# EasyEDA Pro project htx-studio-project_kpilekig-42ad306f.epro, board MotorLimit
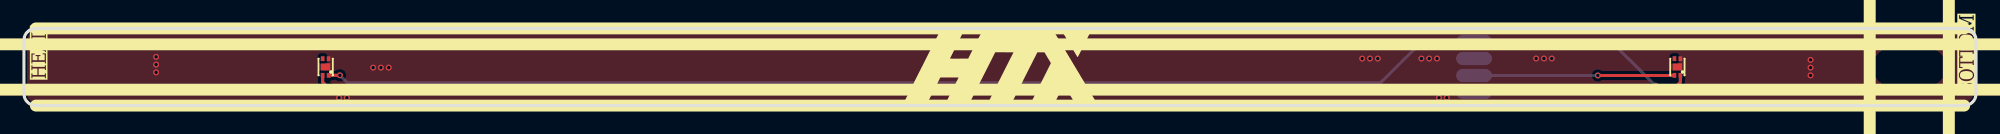
[diagram p8: board, top side]
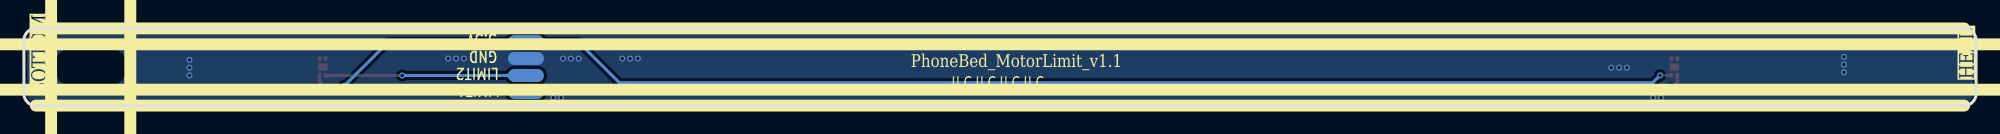
[diagram p9: board, bottom side, seen from below]

Outline 163.19 x 6.5 mm; copper layers: Top Layer, Bottom Layer. Coordinates in mm from the lower left corner of the outline.
Outline path: 0,5.5 0,1 arc(0.29,0.29) 1,0 162.19,0 arc(162.9,0.29) 163.19,1 163.19,5.5 arc(162.9,6.21) 162.19,6.5 1,6.5 arc(0.29,6.21) 0,5.5
Stack: Top Layer 0.035mm / Dielectric1 1.51mm FR4 er 4.5 / Bottom Layer 0.035mm

## Design rules (mm)
spacing copperThickness1oz (default): track to track 0.102, other pairs 0.152 to 0.3
spacing copperThickness2oz: track to track 0.203, other pairs 0.152 to 0.3
spacing Plane_innerPlane: track to track 0.102, other pairs 0.152 to 0.3
spacing Copper_copperRegion: track to track 0.102, other pairs 0.152 to 0.3
track width copperThickness1oz (default): min 0.127, default 0.254, max 2.54
track width copperThickness2oz: min 0.203, default 0.254, max 2.54
differential pair differentialPair (default): width min 0.127, default 0.254, max 2.54; gap min 0.152, default 0.152
pour e25 uses Copper_copperRegion
pour e67 uses Copper_copperRegion

## Placement (name value [footprint] x y rotation side)
NOREF  -  [Pad_e3]  121.22 3.96 180 top
NOREF#2  -  [Pad_e1]  121.22 1.11 180 top
NOREF#3  -  [Pad_e2]  121.22 2.54 180 top
NOREF#4  -  [Pad_e4]  121.22 5.39 180 top
U17  DRV5032FADMRR  [XFDFN-4_L1.4-W1.1-P0.50-BL-EP]  25.22 3.25 90 top
U22  DRV5032FADMRR  [XFDFN-4_L1.4-W1.1-P0.50-BL-EP]  138.22 3.25 90 top

## Footprints (pads in the part's own frame, mm; a bottom-side part is the same pattern mirrored in y, then rotated)
Pad_e1
  oval 3x1.1 smd far side: 1(0,0)
Pad_e2
  oval 3x1.1 smd far side: 1(0,0)
Pad_e3
  oval 3x1.1 smd far side: 1(0,0)
Pad_e4
  oval 3x1.1 smd far side: 1(0,0)
XFDFN-4_L1.4-W1.1-P0.50-BL-EP
  rect 0.4x0.3 smd: 1(-0.7,-0.25) 2(0.7,-0.25) 3(0.7,0.25) 4(-0.7,0.25)
  rect 0.6x0.8 smd: 5(0,0)

## Nets
+3.3V: NOREF#4.1 U17.1 U22.1
GND: NOREF.1 U17.2 U17.5 U22.2 U22.5
GPIO1: NOREF#2.1 U17.4
GPIO2: NOREF#3.1 U22.4

Pads without a net: U17 3; U22 3

## Via types
v1: diameter 0.5, hole 0.3, Top Layer to Bottom Layer, 29 vias

## Routing (per net, layer and track width the routed paths; a pad name or vN(x,y) marks a point on that pad's centre or on a via; arc(x,y) is an arc through that point)
+3.3V: length 116.9
  Top Layer w0.254: v1(136.4,1.67) 138.18,1.67 138.47,1.97 U22.1 ; U17.1 v1(26.42,2.55)
  Bottom Layer w0.254: v1(136.4,1.67) 132.68,5.39 NOREF#4.1 116.88,5.39 113.41,1.93 27.04,1.93 v1(26.42,2.55)
GND:
  vias: v1(11.05,4.11) v1(11.05,3.45) v1(11.05,2.8) v1(26.34,0.66) v1(27,0.66) v1(29.19,3.2) v1(29.84,3.2) v1(30.5,3.2) v1(111.87,3.96) v1(112.52,3.96) v1(113.17,3.96) v1(116.82,3.96) v1(117.48,3.96) v1(118.13,3.96) v1(118.29,0.66) v1(118.94,0.66) v1(123.81,1.17) v1(124.46,1.17) v1(125.11,1.17) v1(126.41,3.96) v1(127.07,3.96) v1(127.72,3.96) v1(149.35,3.85) v1(149.35,3.2) v1(149.35,2.55)
GPIO1: length 97.2
  Top Layer w0.254: v1(25.53,1.42) 24.97,1.98 U17.4
  Bottom Layer w0.254: NOREF#2.1 120.91,1.42 v1(25.53,1.42)
GPIO2: length 16.8
  Top Layer w0.254: v1(131.57,2.54) 137.96,2.54 U22.4
  Bottom Layer w0.254: NOREF#3.1 v1(131.57,2.54)

## Copper pours and planes (outline as drawn; the poured copper is in the pictures)
GND on Top Layer: 0,5.5 0.02,5.68 0.07,5.87 0.17,6.05 0.29,6.21 0.45,6.33 0.63,6.43 0.82,6.48 1,6.5 162.19,6.5 162.37,6.48 162.56,6.43 162.74,6.33 162.9,6.21 163.02,6.05 163.12,5.87 163.17,5.68 163.19,5.5 163.19,1 163.17,0.82 163.12,0.63 163.02,0.45 162.9,0.29 162.74,0.17 162.56,0.07 162.37,0.02 162.19,0 1,0 0.82,0.02 0.63,0.07 0.45,0.17 0.29,0.29 0.17,0.45 0.07,0.63 0.02,0.82 0,1
GND on Bottom Layer: 0,5.5 0.02,5.68 0.07,5.87 0.17,6.05 0.29,6.21 0.45,6.33 0.63,6.43 0.82,6.48 1,6.5 162.19,6.5 162.37,6.48 162.56,6.43 162.74,6.33 162.9,6.21 163.02,6.05 163.12,5.87 163.17,5.68 163.19,5.5 163.19,1 163.17,0.82 163.12,0.63 163.02,0.45 162.9,0.29 162.74,0.17 162.56,0.07 162.37,0.02 162.19,0 1,0 0.82,0.02 0.63,0.07 0.45,0.17 0.29,0.29 0.17,0.45 0.07,0.63 0.02,0.82 0,1

Small or netless copper shapes (teardrops, artwork), in the pictures only: 6 on Top Layer, 8 on Bottom Layer

## Text on the board
Bottom Silkscreen Layer: JLCJLCJLCJLC | LIMIT1 | LIMIT2 | GND | 3.3V | PhoneBed_MotorLimit_v1.1 | HEAD | BOTTOM
Top Silkscreen Layer: HEAD | BOTTOM
